# Altium schematic sheet Connector_Section.SchDoc
size A; DocumentNumber: 2; SheetNumber: 2; SheetTotal: 2
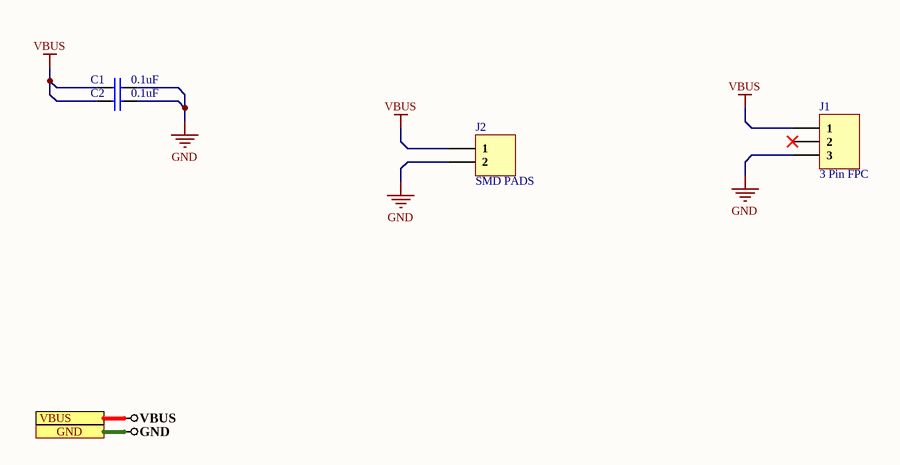
[diagram p0: Connector_Section.SchDoc]

## Parts
C1  0.1uF  [CAP 0201]
C2  0.1uF  [CAP 0201]
J1  3 Pin FPC  [3 Pin FPC]
J2  SMD PADS  [SMD PAD]

## Ports
GND, VBUS

## Nets
GND: C1.2 C2.2 J1.3 J2.2 ; port GND
VBUS: C1.1 C2.1 J1.1 J2.1 ; port VBUS

Not connected (* = marked no-connect by the designer): J1 2*

## Library data of the parts
C1 C2 = GRM033R61E104KE14D: Multilayer Ceramic Capacitors MLCC - SMD/SMT 0201 0.1uF 25volts X5R 10%; Manufacturer: Murata; Capacitance: 100nF; Voltage Rating: 25V; Supplier 1: Mouser; Manufacturer Part Number: GRM033R61E104KE14D; RoHS: Yes; Category: Ceramic Capacitors; Stock 1: 22478; Pricing 1: 1=0.10000, 10=0.03100, 50=0.03100, 100=0.02500, 1000=0.01700, 10000=0.01400 (USD); Mount: Surface Mount; Case/Package: 0201; Case Code (Metric): 0603; Case Code (Imperial): 0201; Weight: 1.2E-05oz; Min Operating Temperature: -55°C; Max Operating Temperature: 85°C; Packaging: Tape and Reel; Tolerance: 10%; Dielectric: X5R; Termination: SMD/SMT; Resistor Type: Ceramic; Voltage Rating (DC): 25V; Package Quantity: 15000; Length: 0.024inch; Width: 0.012inch; Height: 0.3mm; Thickness: 0.013inch; Lead Free: Lead Free; RoHS Compliant: Yes; ComponentLink1URL: http://www.farnell.com/datasheets/2867843.pdf?src-supplier=Farnell; ComponentLink1Description: http://www.farnell.com/datasheets/2867843.pdf?src-supplier=Farnell; ComponentLink2URL: http://www.mouser.com/ds/2/281/c02e-2905.pdf?src-supplier=Mouser; ComponentLink2Description: http://www.mouser.com/ds/2/281/c02e-2905.pdf?src-supplier=Mouser; ComponentLink3URL: http://search.murata.co.jp/Ceramy/image/img/A01X/G101/ENG/GRM033R61E104KE14-01.pdf?src-supplier=Digi-Key; ComponentLink3Description: http://search.murata.co.jp/Ceramy/image/img/A01X/G101/ENG/GRM033R61E104KE14-01.pdf?src-supplier=Digi-Key; ComponentLink4URL: http://www.farnell.com/datasheets/2867843.pdf?src-supplier=Newark; ComponentLink4Description: http://www.farnell.com/datasheets/2867843.pdf?src-supplier=Newark; Supplier Part Number 1: 81-GRM033R61E104KE4D
J1 = 3 Pin FPC: CONN FPC 3POS 0.5MM SMD R/A; ComponentLink1URL: https://www.molex.com/pdm_docs/pk/5051479200-200.pdf?src-supplier=Digi-Key; ComponentLink1Description: https://www.molex.com/pdm_docs/pk/5051479200-200.pdf?src-supplier=Digi-Key; ComponentLink2URL: http://www.molex.com/pdm_docs/sd/5051470390_sd.pdf?src-supplier=Digi-Key; ComponentLink2Description: http://www.molex.com/pdm_docs/sd/5051470390_sd.pdf?src-supplier=Digi-Key; ComponentLink3URL: https://www.molex.com/pdm_docs/sd/5051470390_sd.pdf?src-supplier=Digi-Key; ComponentLink3Description: https://www.molex.com/pdm_docs/sd/5051470390_sd.pdf?src-supplier=Digi-Key
J2 = SMD PAD